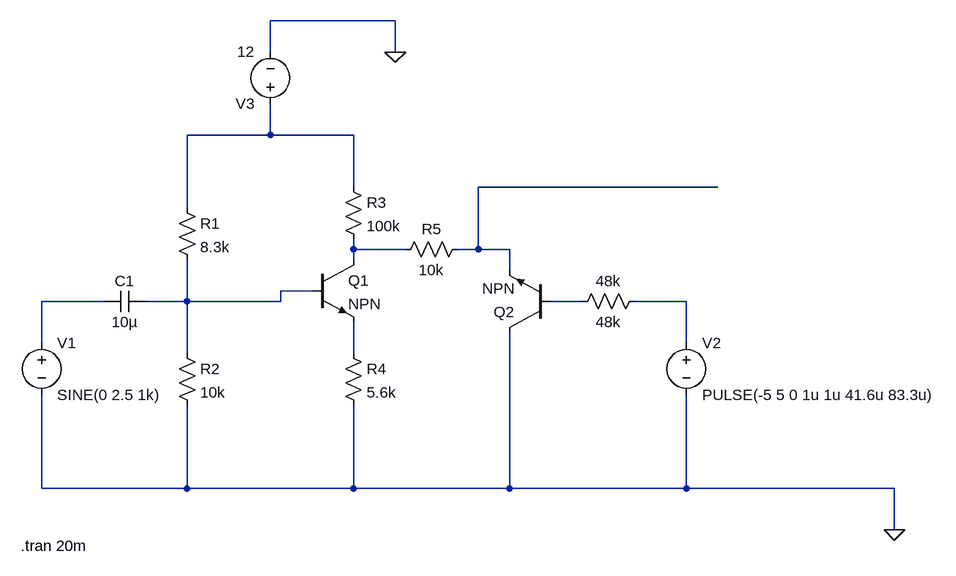
[diagram p0: schematic Pulse Amplitude modulation and demodulation.asc]
Pulse Amplitude modulation and demodulation.asc, the LTspice schematic file:
Version 4
SHEET 1 1496 680
WIRE 512 -384 320 -384
WIRE 320 -336 320 -384
WIRE 512 -336 512 -384
WIRE 320 -208 320 -256
WIRE 320 -208 192 -208
WIRE 448 -208 320 -208
WIRE 448 -128 448 -208
WIRE 1008 -128 640 -128
WIRE 192 -96 192 -208
WIRE 448 -32 448 -48
WIRE 528 -32 448 -32
WIRE 640 -32 640 -128
WIRE 640 -32 608 -32
WIRE 688 -32 640 -32
WIRE 448 -16 448 -32
WIRE 688 0 688 -32
WIRE 384 32 336 32
WIRE 64 48 -32 48
WIRE 192 48 192 -16
WIRE 192 48 128 48
WIRE 336 48 336 32
WIRE 336 48 192 48
WIRE 800 48 752 48
WIRE 960 48 880 48
WIRE -32 112 -32 48
WIRE 960 112 960 48
WIRE 192 128 192 48
WIRE 448 128 448 80
WIRE -32 336 -32 192
WIRE 192 336 192 208
WIRE 192 336 -32 336
WIRE 448 336 448 208
WIRE 448 336 192 336
WIRE 688 336 688 96
WIRE 688 336 448 336
WIRE 960 336 960 192
WIRE 960 336 688 336
WIRE 1280 336 960 336
WIRE 1280 400 1280 336
FLAG 512 -336 0
FLAG 1280 400 0
SYMBOL voltage -32 96 R0
WINDOW 123 0 0 Left 0
WINDOW 39 0 0 Left 0
SYMATTR InstName V1
SYMATTR Value SINE(0 2.5 1k)
SYMBOL cap 128 32 R90
WINDOW 0 0 32 VBottom 2
WINDOW 3 32 32 VTop 2
SYMATTR InstName C1
SYMATTR Value 10µ
SYMBOL res 176 -112 R0
SYMATTR InstName R1
SYMATTR Value 8.3k
SYMBOL res 176 112 R0
SYMATTR InstName R2
SYMATTR Value 10k
SYMBOL res 432 -144 R0
SYMATTR InstName R3
SYMATTR Value 100k
SYMBOL npn 384 -16 R0
SYMATTR InstName Q1
SYMBOL res 432 112 R0
SYMATTR InstName R4
SYMATTR Value 5.6k
SYMBOL res 624 -48 R90
WINDOW 0 0 56 VBottom 2
WINDOW 3 32 56 VTop 2
SYMATTR InstName R5
SYMATTR Value 10k
SYMBOL npn 752 96 R180
SYMATTR InstName Q2
SYMBOL res 896 32 R90
WINDOW 0 0 56 VBottom 2
WINDOW 3 32 56 VTop 2
SYMATTR InstName 48k
SYMATTR Value 48k
SYMBOL voltage 960 96 R0
WINDOW 123 0 0 Left 0
WINDOW 39 0 0 Left 0
SYMATTR InstName V2
SYMATTR Value PULSE(-5 5 0 1u 1u 41.6u 83.3u)
SYMBOL voltage 320 -240 R180
WINDOW 123 0 0 Left 0
WINDOW 39 0 0 Left 0
SYMATTR InstName V3
SYMATTR Value 12
TEXT -64 424 Left 2 !.tran 20m

The netlist it stands for:
* Pulse Amplitude modulation and demodulation.asc
V1 N005 0 SINE(0 2.5 1k)
C1 N004 N005 10µ
R1 N001 N004 8.3k
R2 N004 0 10k
R3 N001 N003 100k
Q1 N003 N004 N008 0 NPN
R4 N008 0 5.6k
R5 N002 N003 10k
Q2 0 N006 N002 0 NPN
R§48k N007 N006 48k
V2 N007 0 PULSE(-5 5 0 1u 1u 41.6u 83.3u)
V3 N001 0 12
.model NPN NPN
.model PNP PNP
.lib standard.bjt
.tran 20m
.backanno
.end